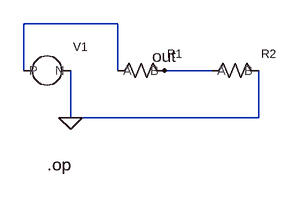
[diagram p0: schematic divider.asc]
divider.asc, the LTspice schematic file:
Version 4
SHEET 1 640 480
SYMBOL voltage 64 64 R0
SYMATTR InstName V1
SYMATTR Value 10
SYMBOL resistor 192 64 R0
SYMATTR InstName R1
SYMATTR Value 1k
SYMBOL resistor 320 64 R0
SYMATTR InstName R2
SYMATTR Value 1k
WIRE 32 64 32 0
WIRE 32 0 160 0
WIRE 160 0 160 64
WIRE 224 64 288 64
FLAG 224 64 out
WIRE 96 64 96 128
WIRE 96 128 352 128
WIRE 352 128 352 64
FLAG 96 128 0
TEXT 64 192 Left 2 !.op

The netlist it stands for:
* divider.asc
V1 N001 0 10
R1 N001 out 1k
R2 out 0 1k
.op
.backanno
.end